# Altium schematic sheet S56_MLD_tiny_Main.SchDoc
size A4; SheetNumber: 1; SheetTotal: 3
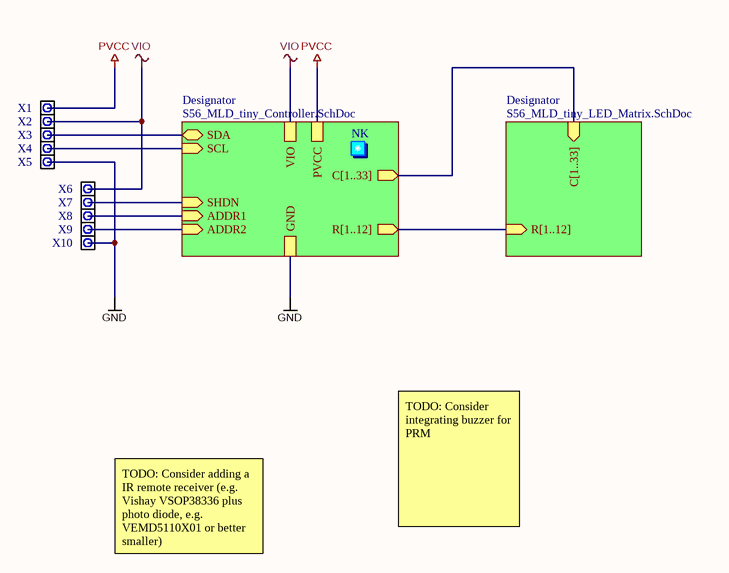
[diagram p0: S56_MLD_tiny_Main.SchDoc]

## Parts
NK  (no value)  [LOGO_NK_0MM5]  (no BOM)
X1  TEST_PIN  [TEST_PAD_S]  (value not drawn)
X2  TEST_PIN  [TEST_PAD_S]  (value not drawn)
X3  TEST_PIN  [TEST_PAD_S]  (value not drawn)
X4  TEST_PIN  [TEST_PAD_S]  (value not drawn)
X5  TEST_PIN  [TEST_PAD_S]  (value not drawn)
X6  TEST_PIN  [TEST_PAD_S]  (value not drawn)
X7  TEST_PIN  [TEST_PAD_S]  (value not drawn)
X8  TEST_PIN  [TEST_PAD_S]  (value not drawn)
X9  TEST_PIN  [TEST_PAD_S]  (value not drawn)
X10  TEST_PIN  [TEST_PAD_S]  (value not drawn)

## Sub-sheets
Designator = S56_MLD_tiny_LED_Matrix.SchDoc: R[1..12] (in), C[1..33] (in)
Designator = S56_MLD_tiny_Controller.SchDoc: GND, VIO, R[1..12] (out), C[1..33] (out), SCL (in), ADDR1 (in), SHDN (in), ADDR2 (in), PVCC, SDA (bidir)

## Nets
GND: X5.1 X10.1 ; sheet Designator/GND
PVCC: X1.1 ; sheet Designator/PVCC
VIO: X2.1 X6.1 ; sheet Designator/VIO
NetX3_1: X3.1 ; sheet Designator/SDA
NetX4_1: X4.1 ; sheet Designator/SCL
NetX7_1: X7.1 ; sheet Designator/SHDN
NetX8_1: X8.1 ; sheet Designator/ADDR1
NetX9_1: X9.1 ; sheet Designator/ADDR2

## Notes on the sheet
- TODO: Consider adding a IR remote receiver (e.g. Vishay VSOP38336 plus photo diode, e.g. VEMD5110X01 or better smaller)
- TODO: Consider integrating buzzer for PRM

## Library data of the parts
NK = GENERIC_SYMBOL